# Altium schematic sheet 转接板.SchDoc
size A4
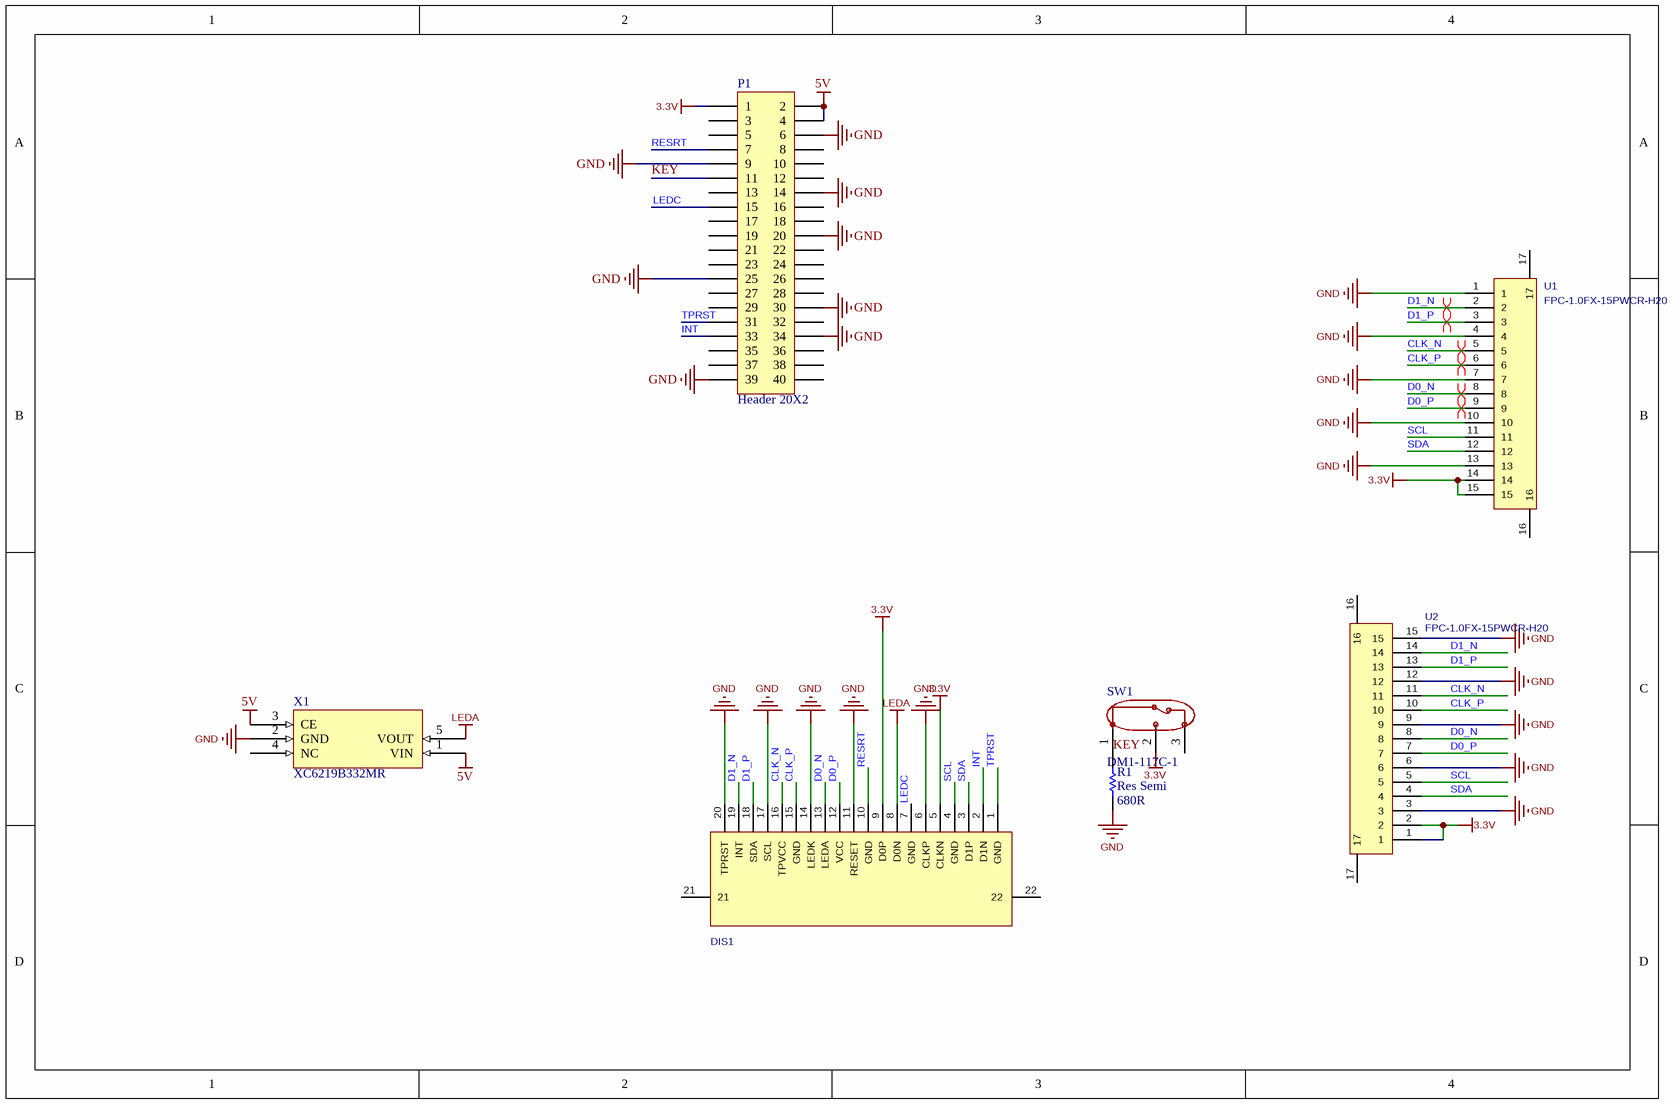
[diagram p0: 转接板.SchDoc]

## Parts
DIS1  FPC-05F-20PH20  [MIPI_display]  (value not drawn)
P1  Header 20X2  [HDR-SMD_40P-P2.54-V-F-R2-C20-S6.6-EH]
R1  Res Semi  value 680R  [1608[0603]]
SW1  DM1-117C-1  [SW-TH_DM1-117C-R]
U1  FPC-1.0FX-15PWCR-H20  [FPC-SMD_15P-P1.00_XUNPU_FPC-1.0FX-15PWCR-H20]
U2  FPC-1.0FX-15PWCR-H20  [FPC-SMD_15P-P1.00_XUNPU_FPC-1.0FX-15PWCR-H20]
X1  XC6219B332MR  [ME6207C33M5G]

## Nets
3.3V: DIS1.5(CLKN) DIS1.9(D0P) P1.1 SW1.2(NO) U1.14 U1.15 U2.1 U2.2
5V: P1.2 P1.4 X1.1(VIN) X1.3(CE)
GND: DIS1.6(CLKP) DIS1.11(RESET) DIS1.14(LEDK) DIS1.17(SCL) DIS1.20(TPRST) P1.6 P1.9 P1.14 P1.20 P1.25 P1.30 P1.34 P1.39 R1.2 U1.1 U1.4 U1.7 U1.10 U1.13 U2.3 U2.6 U2.9 U2.12 U2.15 X1.2(GND)
LEDA: DIS1.8(D0N) X1.5(VOUT)
CLK_N: DIS1.16(TPVCC) U1.5 U2.11
CLK_P: DIS1.15(GND) U1.6 U2.10
D0_N: DIS1.13(LEDA) U1.8 U2.8
D0_P: DIS1.12(VCC) U1.9 U2.7
D1_N: DIS1.19(INT) U1.2 U2.14
D1_P: DIS1.18(SDA) U1.3 U2.13
INT: DIS1.2(D1N) P1.33
KEY: P1.11 R1.1 SW1.1(COM)
LEDC: DIS1.7(GND) P1.15
RESRT: DIS1.10(GND) P1.7
SCL: DIS1.4(GND) U1.11 U2.5
SDA: DIS1.3(D1P) U1.12 U2.4
TPRST: DIS1.1(GND) P1.31

Not connected (* = marked no-connect by the designer): DIS1 21 22; P1 3 5 8 10 12 13 16 17 18 19 21 22 23 24 26 27 28 29 32 35 36 37 38 40; SW1 3(NC); U1 16 17; U2 16 17; X1 4(NC)

## Layout directives
differential pair: CLK_N, CLK_P, D0_N, D0_P, D1_N, D1_P

## Library data of the parts
DIS1 = MIPI触摸屏: Manufacturer: XUNPU(讯普); 3D Model: 73968c39cc2b4cd8b63034a0fc5a76ca聨0819f05c4eef4c71ace90d822a990e87; 3D Model Transform: 566.928,201.5744,0,0,0,0,0.004,-51.182,0; Locking Feature: 翻盖式; Number of Contacts: 20P; Pitch: 0.5mm; FFC, FCB Thickness: 0.3mm; Rated Voltage (Max): 50V; Current Rating (Max): 500mA; AddInBom: yes; ModelName: FPC-SMD_20P-P0.50_XUNPU_FPC-05F-20PH20; Symbol: FPC-05F-20PH20; Device: FPC-05F-20PH20; LCSC Part Name: 翻盖式 卧贴 P数:20P 间距:0.5mm; Supplier Part: C2856803; Manufacturer Part: FPC-05F-20PH20; Supplier Footprint: SMD,P=0.5mm,卧贴; JLCPCB Part Class: Extended Part; Datasheet: https://item.szlcsc.com/datasheet/FPC-05F-20PH20/3056901.html; Supplier: LCSC; Contact Type: 卧贴; Mounting Type: 下接; Height Above Board: 2mm; Contact Material: 磷青铜; Contact Plating: 锡; Operating Temperature: -25℃~+85℃; ConvertToPcb: yes; FootprintName: FPC-SMD_20P-P0.50_XUNPU_FPC-05F-20PH20
P1 = Header 20X2: Header, 20-Pin, Dual row; LatestRevisionDate: 17-Jul-2002; LatestRevisionNote: Re-released for DXP Platform.; Publisher: Altium Limited
R1 = Res Semi: Semiconductor Resistor; Published: 8-Jun-2000; LatestRevisionDate: 17-Jul-2002; LatestRevisionNote: Re-released for DXP Platform.; PackageReference: AXIAL-0.5; Publisher: Altium Limited; PackageDescription: Axial Device, Thru-Hole; 2 Leads; 0.5 in Pin Spacing
SW1 = DM1-117C-1: Manufacturer: XKB Connectivity(中国星坤); Add into BOM: yes; Circuit: 单刀双掷; Switch Length: 12.7mm; Switch Width: 5.7mm; Switch Height: 6.6mm; Contact Current (DC): 1A; Voltage Rating (DC): 30V; Mechanical Life: 100万次; Pin Style: PC引脚; Symbol: DM1-117C-1; Device: DM1-117C-1; LCSC Part Name: 12.7*5.7*6.6mm 插件微动开关; Supplier Part: C466014; Manufacturer Part: DM1-117C-1; Supplier Footprint: 插件; JLCPCB Part Class: 扩展库; Datasheet: https://atta.szlcsc.com/upload/public/pdf/source/20211011/25A564BB7BD898EA2206B0B9E649D2A8.pdf; Supplier: LCSC; Convert to PCB: yes; Type: 微动开关; Operating Temperature: -40℃~+85℃
U1 = FPC-1.0FX-15PWCR-H20: 锁定特性:翻盖式;触点类型:下接;触点数量:15P;间距:1mm;安装方式:卧贴;工作温度:-25℃~+85℃;; Manufacturer: XUNPU(讯普); Locking Feature: 翻盖式; Number of Contacts: 15P; Pitch: 1mm; FFC, FCB Thickness: 0.3mm; Rated Voltage (Max): 50V; Current Rating (Max): 500mA; AddInBom: yes; ModelId: 453220f1d4d14b3f80fde9eb8d63a49d聨0819f05c4eef4c71ace90d822a990e87; ModelTransform: 783.857,236.22,0,0,0,0,0,-55.63,0; Symbol: FPC-1.0FX-15PWCR-H20; Device: FPC-1.0FX-15PWCR-H20; LCSC Part Name: 翻盖式 下接 P数:15P 间距:1mm; Supplier Footprint: SMD,P=1mm,卧贴; JLCPCB Part Class: Extended Part; Datasheet: https://item.szlcsc.com/datasheet/FPC-1.0FX-15PWCR-H20/20530242.html; Supplier: LCSC; Contact Type: 下接; Mounting Type: 卧贴; Height Above Board: 2mm; Contact Material: 铜合金; Contact Plating: 锡; Operating Temperature: -25℃~+85℃; ConvertToPcb: yes; FootprintName: FPC-SMD_15P-P1.00_XUNPU_FPC-1.0FX-15PWCR-H20; ModelName: FPC-SMD_15P-P1.00_XUNPU_FPC-1.0FX-15PWCR-H20; SupplierPart: C19269358; ManufacturerPart: FPC-1.0FX-15PWCR-H20
U2 = FPC-1.0FX-15PWCR-H20: 锁定特性:翻盖式;触点类型:下接;触点数量:15P;间距:1mm;安装方式:卧贴;工作温度:-25℃~+85℃;; Manufacturer: XUNPU(讯普); AddInBom: yes; ModelId: 453220f1d4d14b3f80fde9eb8d63a49d聨0819f05c4eef4c71ace90d822a990e87; ModelTransform: 783.857,236.22,0,0,0,0,0,-55.63,0; Locking Feature: 翻盖式; Number of Contacts: 15P; Pitch: 1mm; FFC, FCB Thickness: 0.3mm; Rated Voltage (Max): 50V; Current Rating (Max): 500mA; Symbol: FPC-1.0FX-15PWCR-H20; Device: FPC-1.0FX-15PWCR-H20; LCSC Part Name: 翻盖式 下接 P数:15P 间距:1mm; SupplierPart: C19269358; ManufacturerPart: FPC-1.0FX-15PWCR-H20; Supplier Footprint: SMD,P=1mm,卧贴; JLCPCB Part Class: Extended Part; Datasheet: https://item.szlcsc.com/datasheet/FPC-1.0FX-15PWCR-H20/20530242.html; Supplier: LCSC; ConvertToPcb: yes; FootprintName: FPC-SMD_15P-P1.00_XUNPU_FPC-1.0FX-15PWCR-H20; ModelName: FPC-SMD_15P-P1.00_XUNPU_FPC-1.0FX-15PWCR-H20; Contact Type: 下接; Mounting Type: 卧贴; Height Above Board: 2mm; Contact Material: 铜合金; Contact Plating: 锡; Operating Temperature: -25℃~+85℃